# Altium schematic sheet Power-Sheet.SchDoc
size 420 x 297 mm; SheetNumber: 1; SheetTotal: 3
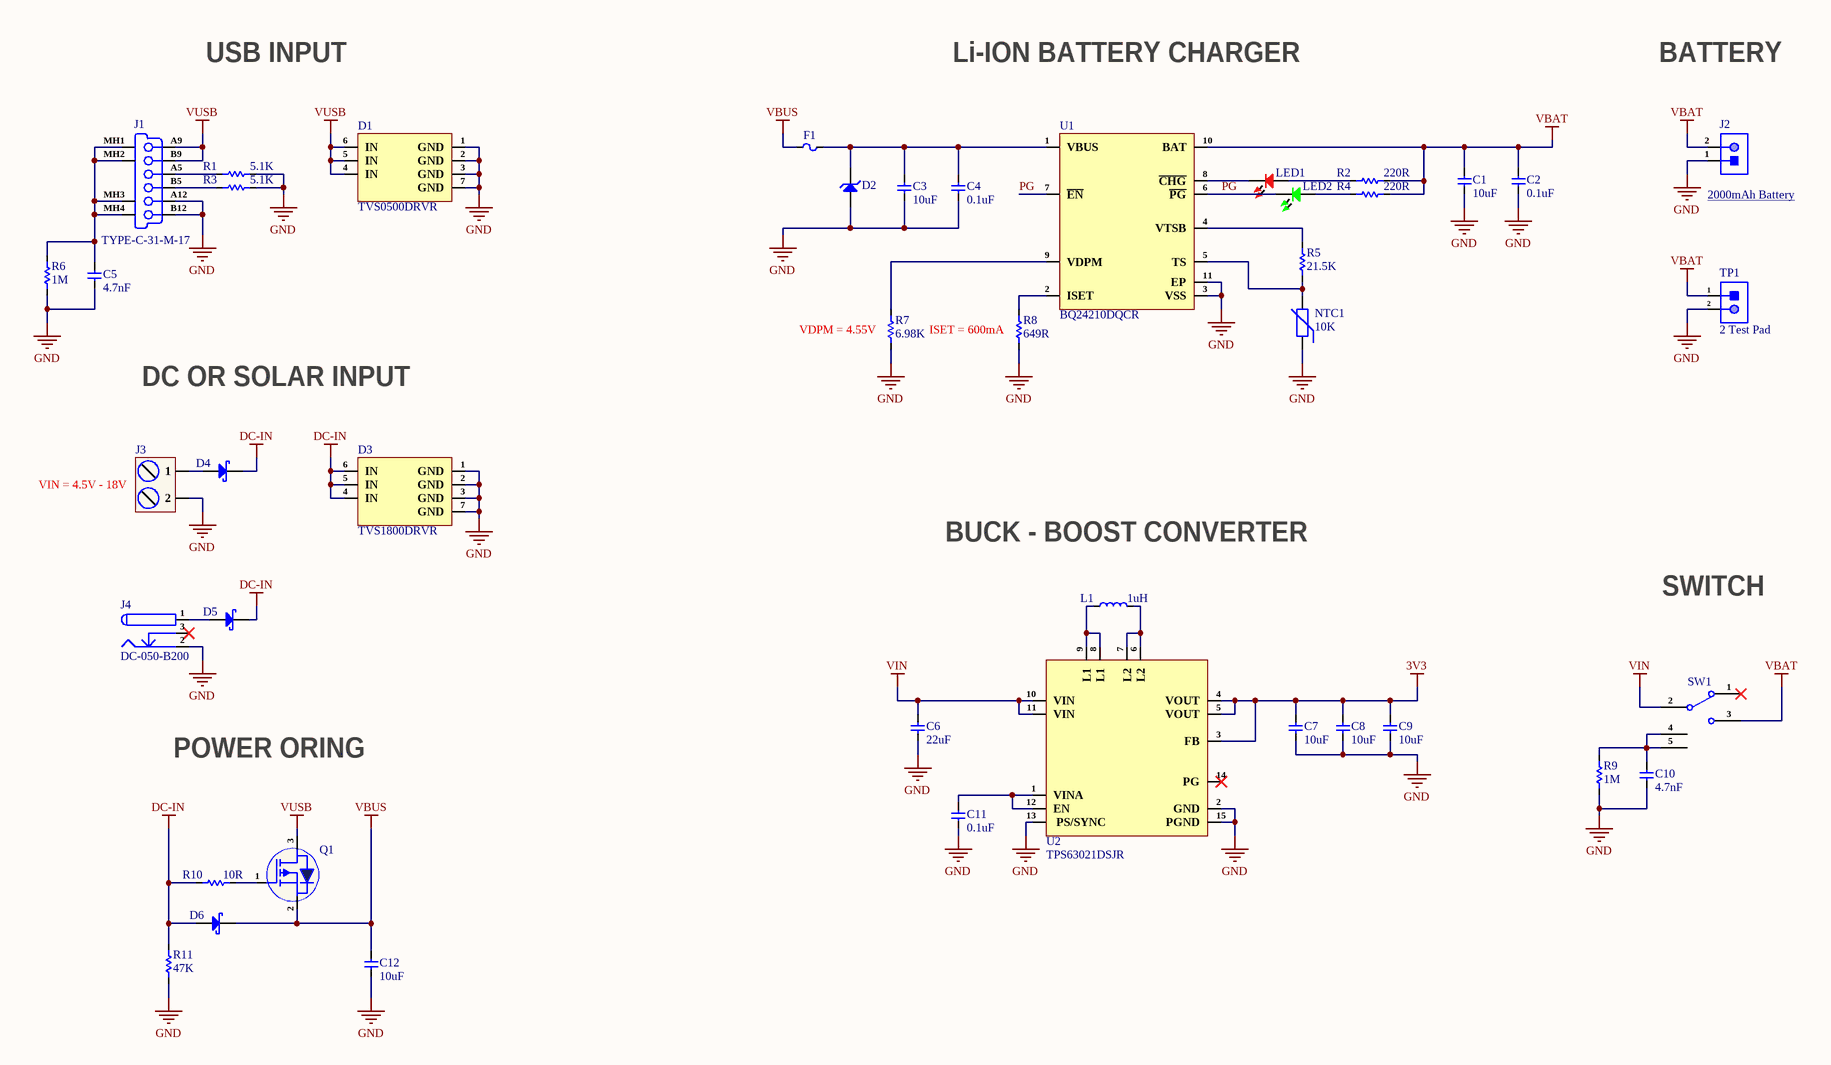
[diagram p0: Power-Sheet.SchDoc]

## Parts
C1  10uF  [Cap-0805]
C2  0.1uF  [Cap-0402]
C3  10uF  [Cap-0805]
C4  0.1uF  [Cap-0402]
C5  4.7nF  [Cap-1206]
C6  22uF  [Cap-0805]
C7  10uF  [Cap-0603]
C8  10uF  [Cap-0603]
C9  10uF  [Cap-0603]
C10  4.7nF  [Cap-1206]
C11  0.1uF  [Cap-0402]
C12  10uF  [Cap-0805]
D1  TVS0500DRVR  [WSON-6(2x2)]
D2  SMBJ5355B-MS  [SMB_]  (value not drawn)
D3  TVS1800DRVR  [WSON-6(2x2)]
D4  SS24A  [SMA]  (value not drawn)
D5  SS24A  [SMA]  (value not drawn)
D6  SS24A  [SMA]  (value not drawn)
F1  1210L075/24PR  [FUSE-1210]  (value not drawn)
J1  TYPE-C-31-M-17  [TYPE-C-31-M-17_]
J2  S2B-PH-SM4-TB(LF)(SN)  [S2B-PH-SM4-TB(LF)(SN)]  (value not drawn)
J3  DB128L-5.08-2P-GN-S  [DB128L-5.08-2P-GN-S]  (value not drawn)
J4  DC-050-B200  [DC-050-B200]
L1  1uH  [IND-1008 (2520 Metric)]
LED1  RED  [LED-0603]  (value not drawn)
LED2  Emerald  [LED-0603]  (value not drawn)
NTC1  10K  [MF51B 103F3435]
Q1  AOSS21311C  [SOT-23]  (value not drawn)
R1  5.1K  [Res-0402]
R2  220R  [Res-0402]
R3  5.1K  [Res-0402]
R4  220R  [Res-0402]
R5  21.5K  [Res-0402]
R6  1M  [Res-0603]
R7  6.98K  [Res-0402]
R8  649R  [Res-0402]
R9  1M  [Res-0603]
R10  10R  [Res-0603]
R11  47K  [Res-0402]
SW1  SK-12D29-G060  [SK-12D29-G060]  (value not drawn)
TP1  2 Test Pad  [2 Test Pad]  (no BOM)
U1  BQ24210DQCR  [10-WSON (3x2)]
U2  TPS63021DSJR  [14-VSON (4x3)]

## Nets
3V3: C7.2 C8.2 C9.2 U2.3(FB) U2.4(VOUT) U2.5(VOUT)
DC-IN: D3.4(IN) D3.5(IN) D3.6(IN) D4.1(K) D5.1(K) D6.2(A) R10.1 R11.2
GND: C1.1 C2.1 C3.1 C4.1 C5.1 C6.1 C7.1 C8.1 C9.1 C10.1 C11.1 C12.1 D1.1(GND) D1.2(GND) D1.3(GND) D1.7(GND) D2.1(A) D3.1(GND) D3.2(GND) D3.3(GND) D3.7(GND) J1.A12(GND) J1.B12(GND) J2.1 J3.2 J4.2 NTC1.1 R1.2 R3.2 R6.1 R7.1 R8.1 R9.1 R11.1 TP1.2 U1.3(VSS) U1.11(EP) U2.2(GND) U2.13(PS/SYNC) U2.15(PGND)
VBAT: C1.2 C2.2 J2.2 R2.2 R4.2 SW1.3 TP1.1 U1.10(BAT)
VBUS: C12.2 D6.1(K) F1.1 Q1.2(S)
VIN: C6.2 SW1.2 U2.10(VIN) U2.11(VIN)
VUSB: D1.4(IN) D1.5(IN) D1.6(IN) J1.A9(VBUS) J1.B9(VBUS) Q1.3(D)
PG: LED2.2 U1.6(~{PG}) U1.7(~{EN})
NetC3_2: C3.2 C4.2 D2.2(K) F1.2 U1.1(VBUS)
NetC5_2: C5.2 J1.MH1(Tab) J1.MH2(Tab) J1.MH3(Tab) J1.MH4(Tab) R6.2
NetC10_2: C10.2 R9.2 SW1.4 SW1.5
NetC11_2: C11.2 U2.1(VINA) U2.12(EN)
NetD4_2: D4.2(A) J3.1
NetD5_2: D5.2(A) J4.1
NetJ1_A5: J1.A5(CC1) R1.1
NetJ1_B5: J1.B5(CC2) R3.1
NetL1_1: L1.1 U2.8(L1) U2.9(L1)
NetL1_2: L1.2 U2.6(L2) U2.7(L2)
NetLED1_1: LED1.1 R2.1
NetLED1_2: LED1.2 U1.8(~{CHG})
NetLED2_1: LED2.1 R4.1
NetNTC1_2: NTC1.2 R5.1 U1.5(TS)
NetQ1_1: Q1.1(G) R10.2
NetR5_2: R5.2 U1.4(VTSB)
NetR7_2: R7.2 U1.9(VDPM)
NetR8_2: R8.2 U1.2(ISET)

Not connected (* = marked no-connect by the designer): J4 3*; SW1 1*; U2 14(PG)*

## Notes on the sheet
- USB INPUT
- Li-ION BATTERY CHARGER
- BATTERY
- (near J2) 2000mAh Battery <https://vi.aliexpress.com/item/1005009196364640.html>
- (near R7) VDPM = 4.55V
- (near R8) ISET = 600mA
- DC OR SOLAR INPUT
- (near J3) VIN = 4.5V - 18V
- BUCK - BOOST CONVERTER
- SWITCH
- POWER ORING
- File:
- Title:
- Date:
- Page
- Num:
- Total:
- Drawn By: Huzaifa Ali

## Library data of the parts
C1 C3 C12 = GRM21BZ71E106KE15L: CAP CER 10UF 25V X7R 0805; Manufacturer: Murata; Item Type: Capacitors; Material: 4241ConductorMaterial; Tolerance: 10%; Supplier: Mouser; LCSC Part Number: C237493; Manufacturer Part Number: GRM21BZ71E106KE15L; RoHS: Yes; Stock: 43117; Pricing: 1=0.34, 10=0.142, 50=0.142, 100=0.096, 1000=0.086, 10000=0.058 (USD); Case/Package: 339Case; Min Operating Temperature: -55°C; Max Operating Temperature: 125°C; Value: 10uF; Voltage Rating: 25V; Length: 2mm; Width: 1.25mm; Height: 1.45mm; Thickness: 1.25mm; RoHS Compliant: Yes
C2 C4 C11 = CC0402KRX7R8BB104: CAP CER 0.1UF 25V X7R 0402; Manufacturer: Yageo; Tolerance: 10%; Capacitance: 100nF; Dissipation Factor: 3.5%; Supplier 1: Digi-Key; Manufacturer Part Number: CC0402KRX7R8BB104; RoHS: Yes; Category: Ceramic Capacitors; Stock 1: 1841009; Pricing 1: 1=0.10000, 10=0.03100, 50=0.01700, 100=0.01390, 500=0.00990, 1000=0.00777, 2500=0.00707, 5000=0.00650 (USD); Mount: Surface Mount; Case/Package: 0402; Case Code (Imperial): 0402; Case Code (Metric): 1005; Min Operating Temperature: -55°C; Max Operating Temperature: 125°C; Dielectric: X7R; Voltage Rating: 25V; Voltage Rating (DC): 25V; Packaging: Tape and Reel; Termination: SMD/SMT; Resistor Type: Ceramic; Length: 1mm; Width: 0.02inch; Height: 0.5mm; Thickness: 0.022inch; Depth: 0.5mm; Radiation Hardening: No; Lead Free: Lead Free; Halogen Free: Halogen Free; ComponentLink1URL: https://datasheet.ciiva.com/11464/upy-gphc-x7r-6-3v-to-50v-8-11464889.pdf?src-supplier=Avnet; ComponentLink1Description: https://datasheet.ciiva.com/11464/upy-gphc-x7r-6-3v-to-50v-8-11464889.pdf?src-supplier=Avnet; ComponentLink2URL: https://datasheet.ciiva.com/13210/upy-gphc-x7r-6-3v-to-50v-8-12304-13210908.pdf?src-supplier=Mouser; ComponentLink2Description: https://datasheet.ciiva.com/13210/upy-gphc-x7r-6-3v-to-50v-8-12304-13210908.pdf?src-supplier=Mouser; ComponentLink3URL: https://datasheet.ciiva.com/17437/upy-gphc-x7r-6-3v-to-50v-8-17437357.pdf?src-supplier=Avnet+Europe; ComponentLink3Description: https://datasheet.ciiva.com/17437/upy-gphc-x7r-6-3v-to-50v-8-17437357.pdf?src-supplier=Avnet+Europe; Supplier Part Number 1: 311-2077-1-ND; LCSC Part Number: C105883
C5 C10 = CC1206KKX7RCBB472: CAP CER 4700PF 1KV X7R 1206; Manufacturer: Yageo; Dielectric Material: Ceramic; Tolerance: 10%; Item Type: Capacitor; Supplier 1: Future Electronics; Manufacturer Part Number: CC1206KKX7RCBB472; RoHS: Yes; Category: Ceramic Capacitors; Stock 1: 180000; Pricing 1: 3000=0.02860, 9000=0.02750, 15000=0.02700, 45000=0.02600, 75000=0.02510 (USD); Mount: Surface Mount; Case/Package: 1206; Number of Pins: 2; Case Code (Imperial): 1206; Case Code (Metric): 3216; Weight: 0.000571oz; Min Operating Temperature: -55°C; Max Operating Temperature: 125°C; Voltage Rating: 1kV; Capacitance: 4.7nF; Packaging: Tape and Reel; Voltage Rating (DC): 1kV; Dielectric: X7R; Termination: SMD/SMT; Resistor Type: Ceramic; Series: CC; Length: 3.2mm; Width: 0.063inch; Thickness: 0.057inch; Depth: 1.6mm; Radiation Hardening: No; Lead Free: Lead Free; RoHS Compliant: Yes; ComponentLink1URL: https://datasheet.ciiva.com/13208/upy-gp-np0-16v-to-50v-8-13208693.pdf?src-supplier=Mouser; ComponentLink1Description: https://datasheet.ciiva.com/13208/upy-gp-np0-16v-to-50v-8-13208693.pdf?src-supplier=Mouser; ComponentLink2URL: https://datasheet.ciiva.com/11466/hv-11466701.pdf?src-supplier=Avnet; ComponentLink2Description: https://datasheet.ciiva.com/11466/hv-11466701.pdf?src-supplier=Avnet; Supplier Part Number 1: 7130131; LCSC Part Number: C107198
C6 = GRM21BZ71A226ME15L: CAP CER 22UF 10V X7R 0805; Manufacturer: Murata; Material: 4241ConductorMaterial; Tolerance: 20%; Item Type: Capacitor; Supplier: Digi-Key; Supplier Part Number: 490-GRM21BZ71A226ME15LCT-ND; Manufacturer Part Number: GRM21BZ71A226ME15L; RoHS: Yes; Category: Ceramic Capacitors; Stock: 49126; Pricing: 1=0.39, 10=0.259, 50=0.191, 100=0.1556, 500=0.12282, 1000=0.10372 (USD); Package: 0805; Min Operating Temperature: -55°C; Max Operating Temperature: 125°C; Value: 22uF; Voltage Rating: 10V; Length: 2mm; Width: 1.25mm; Height: 1.45mm; Thickness: 1.25mm; ComponentLink1URL: https://datasheet.octopart.com/GRM21BZ71A226ME15L-Murata-datasheet-165579666.pdf?src-supplier=TME; ComponentLink1Description: https://datasheet.octopart.com/GRM21BZ71A226ME15L-Murata-datasheet-165579666.pdf?src-supplier=TME; LCSC Part Number: C907991; ComponentLink2Description: LCSC; ComponentLink2URL: https://www.lcsc.com/product-detail/Multilayer-Ceramic-Capacitors-MLCC-SMD-SMT_Murata-Electronics-GRM21BZ71A226ME15L_C907991.html
C7-C9 = GRM188Z71A106KA73D: CAP CER 10UF 10V X7R 0603; Manufacturer: Murata; Item Type: Capacitor; Material: 4241ConductorMaterial; Tolerance: 10%; Supplier: Mouser; LCSC Part Number: C2959727; Manufacturer Part Number: GRM188Z71A106KA73D; RoHS: Yes; Stock: 390983; Pricing: 1=0.36, 10=0.155, 50=0.155, 100=0.104, 1000=0.094, 10000=0.065 (USD); Case/Package: 345Case; Min Operating Temperature: -55°C; Max Operating Temperature: 125°C; Value: 10uF; Voltage Rating: 10V; Length: 1.6mm; Width: 800um; Height: 1mm; Thickness: 800um; RoHS Compliant: Yes; ComponentLink1URL: https://datasheet.octopart.com/GRM188Z71A106KA73D-Murata-datasheet-165579666.pdf?src-supplier=TME; ComponentLink1Description: https://datasheet.octopart.com/GRM188Z71A106KA73D-Murata-datasheet-165579666.pdf?src-supplier=TME
D1 = TVS0500DRVR: 9.5V 400W 7.5V 5V WSON-6(2x2) ESD and Surge Protection (TVS/ESD) ROHS; Manufacturer: Texas Instruments; Item Type: TVS Diodes; Supplier: Digikey; LCSC Part Number: C609571; Manufacturer Part Number: TVS0500DRVR; RoHS: Yes; Stock: 3745; Pricing: 1=0.51, 10=0.373, 100=0.254, 500=0.199, 1000=0.178 (USD); ComponentLink1URL: http://www.ti.com/lit/ds/symlink/tvs0500.pdf?src-supplier=Farnell; ComponentLink1Description: http://www.ti.com/lit/ds/symlink/tvs0500.pdf?src-supplier=Farnell; ComponentLink2URL: http://www.ti.com/lit/ds/symlink/tvs0500.pdf?src-supplier=Digikey; ComponentLink2Description: http://www.ti.com/lit/ds/symlink/tvs0500.pdf?src-supplier=Digikey
D2 = SMBJ5355B-MS: Independent 5W 18V SMB Zener Diodes ROHS; Manufacturer: MSKSEMI; Item Type: Diode; Manufacturer Part Number: SMBJ5355B-MS; Package: SMB; LCSC Part Number: C18547762; ComponentLink1Description: LCSC; ComponentLink1URL: https://lcsc.com/product-detail/Zener-Diodes_MSKSEMI-SMBJ5355B-MS_C18547762.html
D3 = TVS1800DRVR: 1 Surface Mount WSON-6(2x2) Surge Protection Devices (SPDs) ROHS; Manufacturer: Texas Instruments; Item Type: ESD Diode; Supplier: Mouser; LCSC Part Number: C2649846; Manufacturer Part Number: TVS1800DRVR; RoHS: Yes; Stock: 5073; Pricing: 1=0.5, 10=0.388, 50=0.388, 100=0.294, 1000=0.227, 10000=0.185 (USD); Pins: 6NUMBER; Length: 2mm; Width: 2mm; Height: 800um; Thickness: 750um; ComponentLink1URL: http://www.ti.com/general/docs/suppproductinfo.tsp?distId=10&amp;gotoUrl=http%3A%2F%2Fwww.ti.com%2Flit%2Fgpn%2Ftvs1800&src-supplier=Digikey; ComponentLink1Description: http://www.ti.com/general/docs/suppproductinfo.tsp?distId=10&amp;gotoUrl=http%3A%2F%2Fwww.ti.com%2Flit%2Fgpn%2Ftvs1800&src-supplier=Digikey
D4-D6 = SS24A: 40V 500mV@2A 2A SMA(DO-214AC) Schottky Barrier Diodes (SBD) ROHS; Manufacturer: Guangdong Hottech; Manufacturer Part Number: SS24A; Package: SMA(DO-214AC); LCSC Part Number: C2886579; ComponentLink1Description: LCSC; ComponentLink1URL: https://www.lcsc.com/product-detail/Schottky-Barrier-Diodes-SBD_Guangdong-Hottech-SS24A_C2886579.html
F1 = 1210L075/24PR: 24V 750mA 100A 1.5A 1210 Resettable Fuses ROHS; Manufacturer: Littlefuse; Item Type: Fuse; Manufacturer Part Number: 1210L075/24PR; Supplier: Digikey; Supplier Part Number: F4146CT-ND; RoHS: Yes; Category: PTC Resettable Fuses; Stock: 2300; Pricing: 1=0.98, 5=0.81, 10=0.747, 50=0.6196, 100=0.5716, 250=0.51376, 500=0.47378, 1000=0.43676 (USD); Current Rating: 100A; Voltage Rating: 24V; Height: 1.8mm; Lead Free: 5697LeadFree; ComponentLink1URL: https://datasheet.ciiva.com/8005/littelfuse-ptc-1210l-8005372.pdf?src-supplier=Element14; ComponentLink1Description: https://datasheet.ciiva.com/8005/littelfuse-ptc-1210l-8005372.pdf?src-supplier=Element14; ComponentLink2URL: https://datasheet.ciiva.com/326/littelfuse-ptc-1210l-326060.pdf?src-supplier=Digikey; ComponentLink2Description: https://datasheet.ciiva.com/326/littelfuse-ptc-1210l-326060.pdf?src-supplier=Digikey; ComponentLink3URL: https://datasheet.ciiva.com/326/littelfuse-ptc-1210l-326061.pdf?src-supplier=Digikey; ComponentLink3Description: https://datasheet.ciiva.com/326/littelfuse-ptc-1210l-326061.pdf?src-supplier=Digikey; ComponentLink4URL: https://datasheet.ciiva.com/326/littelfuse-ptc-1210l-326062.pdf?src-supplier=Digikey; ComponentLink4Description: https://datasheet.ciiva.com/326/littelfuse-ptc-1210l-326062.pdf?src-supplier=Digikey; LCSC Part Number: C207045
J1 = TYPE-C-31-M-17: Receptacle USB - Type C 6 - USB Connectors ROHS; Manufacturer: Koren Hroparts Elec; Manufacturer Part Number: Type-C-31-M-17; Footprint: Custom; ComponentLink1Description: LCSC; ComponentLink1URL: https://www.lcsc.com/product-detail/USB-Connectors_Korean-Hroparts-Elec-TYPE-C-31-M-17_C283540.html; LCSC Part Number: C283540; Item Type: Connector
J2 = S2B-PH-SM4-TB(LF)(SN): CONN HEADER SMD R/A 2POS 2MM; Manufacturer: JST; Item Type: Connectors; Voltage Rating: 100V; Current Rating: 3A; Insulation Resistance: 1GR; Number of Positions: 2; Gender: 29Gender; Number of Contacts: 2NUMBER; Max Current Rating: 2A; Contact Resistance: 20mR; Supplier: Future Electronics; LCSC Part Number: C295747; Manufacturer Part Number: S2B-PH-SM4-TB(LF)(SN); RoHS: No; Stock: 5000; Pricing: 1000=0.27, 2000=0.265, 3000=0.265, 4000=0.26, 5000=0.25 (USD); Mounting Technology: Surface Mount; Pins: 2NUMBER; Contact Material: Copper Alloy; Color: 46,47Colour; Contact Plating: 154ConductorMaterial; Housing Color: 50Colour; Housing Material: 4302ConductorMaterial; Weight: 28.349523g; Contact Shape: Square; Contact Finish - Mating: TIN; Insulation Material: Nylon; Insulation Color: Natural; Min Operating Temperature: -25°C; Max Operating Temperature: 85°C; Number of Rows: 1; Termination: Solder; Series: PH; Packaging: Cut Tape; Orientation: 5496OrientationType; Max Voltage Rating (AC): 100V; Voltage Rating (AC): 100V; Working Voltage: 100V; Connector Type: Header; Fastening Type: Detent; Contact Type: Male Pin; Voltage Rating (DC): 100V; Number of Poles: 2NUMBER; Length: 11.9mm; Width: 2.34mm; Height: 6mm; Pitch: 2mm; Depth: 7.6mm; Lead Pitch: 2mm; Contact Mating Length: 3.302mm; Flammability Rating: UL94 V-0; Reach SVHC Compliant: 4186SVHC; Lead Free: 5697LeadFree; ComponentLink1URL: http://www.farnell.com/datasheets/1699381.pdf?src-supplier=Farnell; ComponentLink1Description: http://www.farnell.com/datasheets/1699381.pdf?src-supplier=Farnell; ComponentLink2URL: http://datasheet.octopart.com/S2B-PH-SM4-TB-%28LF%29%28SN%29-JST-datasheet-12510261.pdf?src-supplier=Distrelec; ComponentLink2Description: http://datasheet.octopart.com/S2B-PH-SM4-TB-%28LF%29%28SN%29-JST-datasheet-12510261.pdf?src-supplier=Distrelec; ComponentLink3URL: http://www.farnell.com/datasheets/1699381.pdf?src-supplier=Newark; ComponentLink3Description: http://www.farnell.com/datasheets/1699381.pdf?src-supplier=Newark; ComponentLink4URL: https://datasheet.octopart.com/S2B-PH-SM4-TB%28LF%29%28SN%29-JST-datasheet-56537.pdf?src-supplier=Future+Electronics; ComponentLink4Description: https://datasheet.octopart.com/S2B-PH-SM4-TB%28LF%29%28SN%29-JST-datasheet-56537.pdf?src-supplier=Future+Electronics; ComponentLink5URL: http://www.farnell.com/datasheets/1699381.pdf?src-supplier=Element14; ComponentLink5Description: http://www.farnell.com/datasheets/1699381.pdf?src-supplier=Element14; ComponentLink6URL: https://datasheet.octopart.com/S2B-PH-SM4-TB-%28LF%29%28SN%29-JST-datasheet-12510261.pdf?src-supplier=TME; ComponentLink6Description: https://datasheet.octopart.com/S2B-PH-SM4-TB-%28LF%29%28SN%29-JST-datasheet-12510261.pdf?src-supplier=TME
J3 = DB128L-5.08-2P-GN-S: 1x2P 18A -40℃~+105℃ 250V Green 12~30 Straight 5.08mm 2.5 1 2 Plugin,P=5.08mm Screw terminal ROHS; Manufacturer: DORABO; Item Type: Terminal Block; Manufacturer Part Number: DB128L-5.08-2P-GN-S; Package: Plugin,P=5.08mm; LCSC Part Number: C395868; ComponentLink1Description: LCSC; ComponentLink1URL: https://www.lcsc.com/product-detail/Screw-terminal_DORABO-DB128L-5-08-2P-GN-S_C395868.html
J4 = DC-050-B200: Surface Mount DC Power Receptacle -20℃~+70℃ 2mm 6.4mm 2A 30V SMD AC/DC Power Connectors ROHS; Manufacturer: XUNPU; Item Type: DC Jack; Manufacturer Part Number: DC-050-B200; Package: Custom; LCSC Part Number: C720582; ComponentLink1Description: LCSC; ComponentLink1URL: https://www.lcsc.com/product-detail/AC-DC-Power-Connectors_XUNPU-DC-050-B200_C720582.html
L1 = DFE252012P-1R0M=P2: FIXED IND 1UH 3.2A 0.042OHM SMD; Manufacturer: Murata; Item Type: Inductor; Core Material: Ferrite; Current Rating: 4.3A; Shielding: Shielded; DC Resistance (DCR): 42mR; Test Frequency: 1MHz; Tolerance: 20%; Supplier: Future Electronics; LCSC Part Number: C882955; Manufacturer Part Number: DFE252012P-1R0M=P2; RoHS: Yes; Stock: 30000; Pricing: 3000=0.103, 6000=0.1, 9000=0.0987, 12000=0.0976, 15000=0.0942 (USD); Mounting Technology: Surface Mount; Case/Package: 1008; Case Code (Metric): 2520; Case Code (Imperial): 1008; Min Operating Temperature: -40°C; Max Operating Temperature: 125°C; Value: 1uH; Packaging: Cut Tape; Max DC Current: 3.2A; Series: DFE252012P; Inductance Tolerance: 20%; RMS Current (Irms): 3.2A; Saturation Current: 4.3A; ESR: 42mR; Length: 0.098inch; Width: 0.079inch; Height: 1.2mm; Height - Seated (Max): 0.039inch; Depth: 2mm; RoHS Compliant: Yes; ComponentLink1URL: http://www.farnell.com/datasheets/2550134.pdf?src-supplier=Farnell; ComponentLink1Description: http://www.farnell.com/datasheets/2550134.pdf?src-supplier=Farnell; ComponentLink2URL: https://www.murata.com/~/media/webrenewal/products/inductor/chip/tokoproducts/wirewoundmetalalloychiptype/m_dfe252012p.ashx?src-supplier=Digikey; ComponentLink2Description: https://www.murata.com/~/media/webrenewal/products/inductor/chip/tokoproducts/wirewoundmetalalloychiptype/m_dfe252012p.ashx?src-supplier=Digikey; ComponentLink3URL: http://www.murata.com/~/media/webrenewal/products/inductor/chip/tokoproducts/wirewoundmetalalloychiptype/m_dfe252012p.ashx?src-supplier=Digikey; ComponentLink3Description: http://www.murata.com/~/media/webrenewal/products/inductor/chip/tokoproducts/wirewoundmetalalloychiptype/m_dfe252012p.ashx?src-supplier=Digikey; ComponentLink4URL: http://www.toko.co.jp/products/pdf/inductors/dfe252012p.pdf?src-supplier=Avnet; ComponentLink4Description: http://www.toko.co.jp/products/pdf/inductors/dfe252012p.pdf?src-supplier=Avnet
LED1 = NCD0603R3: RED LED 0603 Light Emitting Diodes; Manufacturer: Foshan NationStar Optoelectronics; Manufacturer Part Number: NCD0603R3; Package: 0603; Item Type: LED; LCSC Part Number: C3151730; ComponentLink1Description: LCSC; ComponentLink1URL: https://www.lcsc.com/product-detail/Light-Emitting-Diodes-LED_Foshan-NationStar-Optoelectronics-NCD0603R3_C3151730.html
LED2 = NCD0603G2: Emerald 0603 Light Emitting Diodes (LED) ROHS; Manufacturer: Foshan NationStar Optoelectronics; Manufacturer Part Number: NCD0603G2; Package: 0603; LCSC Part Number: C87326; Item Type: LED; ComponentLink1Description: LCSC; ComponentLink1URL: https://www.lcsc.com/product-detail/Light-Emitting-Diodes-LED_Foshan-NationStar-Optoelectronics-NCD0603G2_C87326.html
NTC1 = MF51B 103F3435: 10kΩ 50mW ±1% NTC Thermistors ROHS; Manufacturer: Nanjing Shiheng Elec; Manufacturer Part Number: MF51B 103F3435; LCSC Part Number: C394029; Item Type: NTC Thermistors; ComponentLink1Description: LCSC; ComponentLink1URL: https://lcsc.com/product-detail/NTC-Thermistors_Nanjing-Shiheng-Elec-MF51B-103F3435_C394029.html
Q1 = AOSS21311C: MOSFET P-CH 30V 4.3A SOT23-3; Manufacturer: Alpha & Omega Semiconductor; Supplier: Digikey; Supplier Part Number: 785-AOSS21311CCT-ND; Manufacturer Part Number: AOSS21311C; RoHS: Yes; Category: Transistors; Stock: 15013; Pricing: 1=0.44, 10=0.314, 100=0.1582, 500=0.14016, 1000=0.10908 (USD); LCSC Part Number: C3280149; Item Type: MOSFET
R1 R3 = RC0402FR-075K1L: RES 5.1K OHM 1% 1/16W 0402; Manufacturer: Yageo; Power Rating: 63mW; Resistance: 5.1kR; Temperature Coefficient: 100ppm/°C; Voltage Rating: 50V; Item Type: Resistor; Supplier 1: Avnet; Manufacturer Part Number: RC0402FR-075K1L; RoHS: Yes; Category: Chip SMD Resistors; Stock 1: 65000; Pricing 1: 10000=0.00085 (USD); Case/Package: 0402; Case Code (Metric): 1005; Case Code (Imperial): 0402; Min Operating Temperature: -55°C; Max Operating Temperature: 155°C; Tolerance: 1%; Technology: THICK FILM; Packaging: Tape and Reel; Package Quantity: 1; Resistor Type: Thick Film; Number of Terminations: 2; Termination: SMD/SMT; Max Power Dissipation: 63mW; Voltage Rating (DC): 50V; Working Voltage: 50V; Features: Moisture Resistant; Series: RC; Resistance Tolerance: 1%; Construction: Rectangular; Length: 1mm; Width: 0.02inch; Height: 0.016inch; Depth: 0.5mm; RoHS Compliant: Yes; Military Standard: Not; Lead Free: Lead Free; ComponentLink1URL: https://datasheet.ciiva.com/7983/1018594-7983519.pdf?src-supplier=Element14; ComponentLink1Description: https://datasheet.ciiva.com/7983/1018594-7983519.pdf?src-supplier=Element14; ComponentLink2URL: https://datasheet.ciiva.com/46394/1018594-46394936.pdf?src-supplier=Element14; ComponentLink2Description: https://datasheet.ciiva.com/46394/1018594-46394936.pdf?src-supplier=Element14; ComponentLink3URL: https://datasheet.ciiva.com/2453/pyu-r-int-thick-7-2453401.pdf?src-supplier=Digi-Key; ComponentLink3Description: https://datasheet.ciiva.com/2453/pyu-r-int-thick-7-2453401.pdf?src-supplier=Digi-Key; ComponentLink4URL: https://datasheet.ciiva.com/2453/pyu-r-int-thick-7-2453402.pdf?src-supplier=Digi-Key; ComponentLink4Description: https://datasheet.ciiva.com/2453/pyu-r-int-thick-7-2453402.pdf?src-supplier=Digi-Key; ComponentLink5URL: https://datasheet.ciiva.com/2453/pyu-r-int-thick-7-2453400.pdf?src-supplier=Digi-Key; ComponentLink5Description: https://datasheet.ciiva.com/2453/pyu-r-int-thick-7-2453400.pdf?src-supplier=Digi-Key; ComponentLink6URL: https://datasheet.ciiva.com/12558/pyu-rc0402-51-rohs-l-6-r-8721-12558460.pdf?src-supplier=Mouser; ComponentLink6Description: https://datasheet.ciiva.com/12558/pyu-rc0402-51-rohs-l-6-r-8721-12558460.pdf?src-supplier=Mouser; ComponentLink7URL: https://datasheet.ciiva.com/16744/pyu-rc0402-51-rohs-l-6-r-16744283.pdf?src-supplier=Future+Electronics; ComponentLink7Description: https://datasheet.ciiva.com/16744/pyu-rc0402-51-rohs-l-6-r-16744283.pdf?src-supplier=Future+Electronics; ComponentLink8URL: https://datasheet.ciiva.com/15189/getdatasheetpartid-323636-15189493.pdf?src-supplier=Verical; ComponentLink8Description: https://datasheet.ciiva.com/15189/getdatasheetpartid-323636-15189493.pdf?src-supplier=Verical; Supplier Part Number 1: RC0402FR-075K1L; LCSC Part Number: C105872
R2 R4 = RC0402FR-07220RL: RES 220 OHM 1% 1/16W 0402; Manufacturer: Yageo; Item Type: Resistors; Power Rating: 62.5mW; Voltage Rating: 50V; Temperature Coefficient: 100ppm/°C; Max Power Dissipation: 63mW; Supplier: Digikey; LCSC Part Number: C112291; Manufacturer Part Number: RC0402FR-07220RL; RoHS: Yes; Stock: 225544; Pricing: 1=0.1, 10=0.007, 100=0.0061, 1000=0.0051, 2500=0.00408 (USD); Case/Package: 0402; Pins: 2; Case Code (Imperial): 0402; Case Code (Metric): 1005; Min Operating Temperature: -55°C; Max Operating Temperature: 155°C; Value: 220R; Tolerance: 1%; Packaging: Tape and Reel; Voltage Rating (DC): 50V; Package Quantity: 1; Termination: SMD/SMT; Resistor Type: Thick Film; Number of Terminations: 2; Features: Moisture Resistant; Series: RC; Resistance Tolerance: 1%; Construction: Rectangular; Technology: THICK FILM; Voltage Rating (AC): 50V; Length: 0.039inch; Width: 0.02inch; Height: 0.016inch; Depth: 0.5mm; Reach SVHC Compliant: No; Military Standard: Not; RoHS Compliant: Yes; Lead Free: 5697LeadFree; ComponentLink1URL: https://datasheet.ciiva.com/2453/pyu-r-int-thick-7-2453461.pdf?src-supplier=Digikey; ComponentLink1Description: https://datasheet.ciiva.com/2453/pyu-r-int-thick-7-2453461.pdf?src-supplier=Digikey
R5 = RT0402BRD0721K5L: RES SMD 21.5KOHM 0.1% 1/16W 0402; Manufacturer: Yageo; Item Type: Resistor; Value: 21.5kR; Power Rating: 62.5mW; Voltage Rating: 50V; Max Power Dissipation: 63mW; Temperature Coefficient: 25ppm/°C; Supplier: Digikey; LCSC Part Number: C852636; Manufacturer Part Number: RT0402BRD0721K5L; RoHS: Yes; Stock: 19982; Pricing: 1=0.16, 10=0.121, 50=0.0958, 100=0.0859, 500=0.0654, 1000=0.0578, 5000=0.04283 (USD); Case/Package: 0402; Case Code (Metric): 1005; Case Code (Imperial): 0402; Min Operating Temperature: -55°C; Max Operating Temperature: 155°C; Package Quantity: 10000; Packaging: Tape and Reel; Tolerance: 0.1%; Number of Terminations: 2; Termination: SMD/SMT; Voltage Rating (DC): 50V; Series: RT; Length: 0.039inch; Width: 0.02inch; Height: 0.014inch; Lead Free: Lead Free; RoHS Compliant: Yes; ComponentLink1URL: https://datasheet.ciiva.com/2582/pyu-rt-1-to-0-05-rohs-l-5-2582228.pdf?src-supplier=Digikey; ComponentLink1Description: https://datasheet.ciiva.com/2582/pyu-rt-1-to-0-05-rohs-l-5-2582228.pdf?src-supplier=Digikey; ComponentLink2URL: https://datasheet.ciiva.com/12725/pyu-rt-1-to-0-05-rohs-l-4-12725964.pdf?src-supplier=Mouser; ComponentLink2Description: https://datasheet.ciiva.com/12725/pyu-rt-1-to-0-05-rohs-l-4-12725964.pdf?src-supplier=Mouser
R6 R9 = RC0603FR-071ML: RES SMD 1M OHM 1% 1/10W 0603; Manufacturer: Yageo; Voltage Rating: 50V; Resistance: 1MR; Power Rating: 100mW; Temperature Coefficient: 100ppm/°C; Item Type: Resistor; Supplier 1: Digi-Key; Manufacturer Part Number: RC0603FR-071ML; Stock 1: 3824601; Pricing 1: 1=0.1, 10=0.023, 100=0.0094, 1000=0.00421, 2500=0.00366 (USD); Case/Package: 0603; Number of Pins: 2; Case Code (Imperial): 0603; Case Code (Metric): 1608; Min Operating Temperature: -55°C; Max Operating Temperature: 155°C; Voltage Rating (DC): 50V; Tolerance: 1%; Packaging: Tape and Reel; Package Quantity: 5000; Termination: SMD/SMT; Composition: Thick Film; Military Standard: Not; Length: 1.6mm; Height: 0.45mm; Width: 0.8mm; Depth: 0.8mm; REACH SVHC: No SVHC; Lead Free: Lead Free; ComponentLink1URL: http://www.farnell.com/datasheets/2167052.pdf?src-supplier=Mouser; ComponentLink1Description: http://www.farnell.com/datasheets/2167052.pdf?src-supplier=Mouser; ComponentLink2URL: http://www.farnell.com/datasheets/2167052.pdf?src-supplier=Element14; ComponentLink2Description: http://www.farnell.com/datasheets/2167052.pdf?src-supplier=Element14; ComponentLink3URL: http://documents.rs-components.com/techlib://itc_doclist_GB.htm?stockno=5048956&src-supplier=RSComponents; ComponentLink3Description: http://documents.rs-components.com/techlib://itc_doclist_GB.htm?stockno=5048956&src-supplier=RSComponents; Supplier Part Number 1: 311-1.00MHRDKR-ND; LCSC Part Number: C105578
R7 = RT0402BRD076K98L: RES SMD 6.98KOHM 0.1% 1/16W 0402; Manufacturer: Yageo; Value: 6.98kR; Power Rating: 62.5mW; Voltage Rating: 50V; Temperature Coefficient: 25ppm/°C; Max Power Dissipation: 63mW; Item Type: Resistor; Supplier 1: Future Electronics; Manufacturer Part Number: RT0402BRD076K98L; RoHS: Yes; Category: Chip SMD Resistors; Stock 1: 9500; Pricing 1: 1=0.173, 20=0.129, 150=0.0997, 1000=0.0719, 5000=0.0482 (USD); Case/Package: 0402; Case Code (Imperial): 0402; Case Code (Metric): 1005; Weight: 2.3E-05oz; Min Operating Temperature: -55°C; Max Operating Temperature: 155°C; Packaging: Tape and Reel; Tolerance: 0.1%; Package Quantity: 10000; Termination: SMD/SMT; Number of Terminations: 2; Voltage Rating (DC): 50V; Series: RT; Length: 0.039inch; Width: 0.5mm; Height: 0.014inch; Lead Free: Lead Free; RoHS Compliant: Yes; ComponentLink1URL: https://datasheet.ciiva.com/2582/pyu-rt-1-to-0-05-rohs-l-4-2582483.pdf?src-supplier=Digi-Key; ComponentLink1Description: https://datasheet.ciiva.com/2582/pyu-rt-1-to-0-05-rohs-l-4-2582483.pdf?src-supplier=Digi-Key; ComponentLink2URL: https://datasheet.ciiva.com/46635/pyu-rt-1-to-0-05-rohs-l-5-46635214.pdf?src-supplier=Digi-Key; ComponentLink2Description: https://datasheet.ciiva.com/46635/pyu-rt-1-to-0-05-rohs-l-5-46635214.pdf?src-supplier=Digi-Key; Supplier Part Number 1: 2098961; LCSC Part Number: C852901
R8 = RT0402BRD07649RL: RES SMD 649 OHM 0.1% 1/16W 0402; Manufacturer: Yageo; Item Type: Resistors; Power Rating: 62.5mW; Voltage Rating: 50V; Temperature Coefficient: 25ppm/°C; Max Power Dissipation: 63mW; Supplier: Digikey; LCSC Part Number: C852879; Manufacturer Part Number: RT0402BRD07649RL; RoHS: Yes; Stock: 26648; Pricing: 1=0.16, 10=0.124, 50=0.1, 100=0.0898, 500=0.06834, 1000=0.06018, 5000=0.04449 (USD); Case/Package: 0402; Case Code (Imperial): 0402; Case Code (Metric): 1005; Weight: 2.3E-05oz; Min Operating Temperature: -55°C; Max Operating Temperature: 125°C; Value: 649R; Packaging: Tape and Reel; Tolerance: 0.1%; Package Quantity: 10000; Termination: SMD/SMT; Number of Terminations: 2; Voltage Rating (DC): 50V; Series: RT; Length: 0.039inch; Width: 0.5mm; Height: 0.014inch; Lead Free: Lead Free; RoHS Compliant: Yes; ComponentLink1URL: https://datasheet.ciiva.com/2582/pyu-rt-1-to-0-05-rohs-l-5-2582460.pdf?src-supplier=Digikey; ComponentLink1Description: https://datasheet.ciiva.com/2582/pyu-rt-1-to-0-05-rohs-l-5-2582460.pdf?src-supplier=Digikey
R10 = RC0603FR-0710RL: RES SMD 10 OHM 1% 1/10W 0603; Manufacturer: Yageo; Temperature Coefficient: 200ppm/°C; Power Rating: 100mW; Voltage Rating: 50V; Item type: Resistor; Supplier 1: Digi-Key; Manufacturer Part Number: RC0603FR-0710RL; Stock 1: 10836596; Pricing 1: 1=0.1, 10=0.046, 100=0.0187, 1000=0.0084, 2500=0.00729 (USD); Case/Package: 0603; Number of Pins: 2; Case Code (Imperial): 0603; Case Code (Metric): 1608; Contact Plating: Tin,Matte; Min Operating Temperature: -55°C; Max Operating Temperature: 155°C; Resistance: 10R; Tolerance: 1%; Composition: Thick Film; Packaging: Tape and Reel; Voltage Rating (DC): 50V; Termination: SMD/SMT; Military Standard: Not; Length: 1.6mm; Height: 0.45mm; Width: 0.8mm; Depth: 0.8mm; Radiation Hardening: No; Lead Free: Lead Free; REACH SVHC: No SVHC; ComponentLink1URL: http://www.farnell.com/datasheets/1868787.pdf?src-supplier=Element14; ComponentLink1Description: http://www.farnell.com/datasheets/1868787.pdf?src-supplier=Element14; ComponentLink2URL: http://www.yageo.com/documents/recent/PYu-RC0603_51_RoHS_L_4.pdf?src-supplier=Avnet; ComponentLink2Description: http://www.yageo.com/documents/recent/PYu-RC0603_51_RoHS_L_4.pdf?src-supplier=Avnet; ComponentLink3URL: http://documents.rs-components.com/techlib://itc_doclist_GB.htm?stockno=5048984&src-supplier=RSComponents; ComponentLink3Description: http://documents.rs-components.com/techlib://itc_doclist_GB.htm?stockno=5048984&src-supplier=RSComponents; ComponentLink4URL: http://www.yageo.com/documents/recent/PYu-RC0603_51_RoHS_L_4.pdf?src-supplier=Avnet+Europe; ComponentLink4Description: http://www.yageo.com/documents/recent/PYu-RC0603_51_RoHS_L_4.pdf?src-supplier=Avnet+Europe; Supplier Part Number 1: 311-10.0HRDKR-ND; LCSC Part Number: C109318
R11 = RC0402FR-0747KL: RES 47K OHM 1% 1/16W 0402; Manufacturer: Yageo; Power Rating: 62.5mW; Temperature Coefficient: 100ppm/°C; Voltage Rating: 50V; Resistance: 47kR; Max Power Dissipation: 63mW; Item Type: Resistor; Supplier 1: Avnet; Manufacturer Part Number: RC0402FR-0747KL; RoHS: Yes; Category: Chip SMD Resistors; Stock 1: 680000; Pricing 1: 10000=0.00085, 20000=0.00087, 40000=0.00084, 60000=0.00083, 80000=0.00079, 100000=0.00078, 1000000=0.00076 (USD); Case/Package: 0402; Case Code (Imperial): 0402; Case Code (Metric): 1005; Size Code: 0402; Min Operating Temperature: -55°C; Max Operating Temperature: 155°C; Tolerance: 1%; Series: RC; Packaging: Tape and Reel; Package Quantity: 1; Termination: SMD/SMT; Resistor Type: Thick Film; Number of Terminations: 2; Features: Moisture Resistant; Resistance Tolerance: 1%; Construction: Rectangular; Length: 1mm; Width: 0.02inch; Height: 0.016inch; Depth: 0.5mm; RoHS Compliant: Yes; Military Standard: Not; Lead Free: Lead Free; ComponentLink1URL: https://datasheet.ciiva.com/46412/1018594-46412839.pdf?src-supplier=Element14; ComponentLink1Description: https://datasheet.ciiva.com/46412/1018594-46412839.pdf?src-supplier=Element14; ComponentLink2URL: https://datasheet.ciiva.com/2453/pyu-r-int-thick-7-2453389.pdf?src-supplier=Digi-Key; ComponentLink2Description: https://datasheet.ciiva.com/2453/pyu-r-int-thick-7-2453389.pdf?src-supplier=Digi-Key; ComponentLink3URL: https://datasheet.ciiva.com/2453/pyu-r-int-thick-7-2453390.pdf?src-supplier=Digi-Key; ComponentLink3Description: https://datasheet.ciiva.com/2453/pyu-r-int-thick-7-2453390.pdf?src-supplier=Digi-Key; ComponentLink4URL: https://datasheet.ciiva.com/2453/pyu-r-int-thick-7-2453388.pdf?src-supplier=Digi-Key; ComponentLink4Description: https://datasheet.ciiva.com/2453/pyu-r-int-thick-7-2453388.pdf?src-supplier=Digi-Key; ComponentLink5URL: https://datasheet.ciiva.com/15189/getdatasheetpartid-323748-15189466.pdf?src-supplier=Verical; ComponentLink5Description: https://datasheet.ciiva.com/15189/getdatasheetpartid-323748-15189466.pdf?src-supplier=Verical; ComponentLink6URL: https://datasheet.ciiva.com/16793/pyu-rc0402-51-rohs-l-6-r-16793430.pdf?src-supplier=Future+Electronics; ComponentLink6Description: https://datasheet.ciiva.com/16793/pyu-rc0402-51-rohs-l-6-r-16793430.pdf?src-supplier=Future+Electronics; Supplier Part Number 1: RC0402FR-0747KL; LCSC Part Number: C93943
SW1 = SK-12D29-G060: Lying 1A SPDT 9.6mm 8.6mm 24V 3.6mm Black PCPin 10000 Rectangular columnar -25℃~+70℃ Plugin Slide Switches ROHS; Manufacturer: G-Switch; Manufacturer Part Number: SK-12D29-G060; Package: Custom; LCSC Part Number: C2848877; Item Type: Slide Switch; ComponentLink1Description: LCSC; ComponentLink1URL: https://www.lcsc.com/product-detail/Slide-Switches_G-Switch-SK-12D29-G060_C2848877.html
TP1 = 2 Test Pad: Wire Connecting Pad; Item Type: Test Point; Manufacturer Part Number: 2 Test Pad
U1 = BQ24210DQCR: IC BATT CHG LI-ION 1CELL 10WSON; Manufacturer: Texas Instruments; Supplier: Mouser; LCSC Part Number: C524795; Manufacturer Part Number: BQ24210DQCR; RoHS: Yes; Item Type: IC; Stock: 11128; Pricing: 1=2.67, 10=1.99, 50=1.82, 100=1.64, 1000=1.45, 10000=1.31 (USD); ComponentLink1URL: https://datasheet.ciiva.com/4874/slusa76a-128668-4874253.pdf?src-supplier=Mouser; ComponentLink1Description: https://datasheet.ciiva.com/4874/slusa76a-128668-4874253.pdf?src-supplier=Mouser; ComponentLink2URL: https://datasheet.ciiva.com/15223/getdatasheetpartid-517676-15223141.pdf?src-supplier=Verical; ComponentLink2Description: https://datasheet.ciiva.com/15223/getdatasheetpartid-517676-15223141.pdf?src-supplier=Verical; ComponentLink3URL: https://datasheet.ciiva.com/1934/bq24210-1934532.pdf?src-supplier=Digikey; ComponentLink3Description: https://datasheet.ciiva.com/1934/bq24210-1934532.pdf?src-supplier=Digikey
U2 = TPS63021DSJR: IC REG BUCK BST 3.3V 3.5A 14VSON; Manufacturer: Texas Instruments; Efficiency: 96%; Number of Outputs: 1; Max Output current: 3A; Min Input Voltage: 1.8V; Max Supply Voltage: 5.5V; Switching Frequency: 2.4MHz; Synchronous Rectifier: Yes; Quiescent Current: 50uA; Output Type: Fixed; Supplier: Mouser; LCSC Part Number: C202140; Manufacturer Part Number: TPS63021DSJR; RoHS: Yes; Item Type: IC; Stock: 4678; Pricing: 1=2.63, 10=1.96, 50=1.8, 100=1.61, 1000=1.43, 10000=1.35 (USD); Mounting Technology: Surface Mount; Case/Package: VSON; Pins: 14; Min Operating Temperature: -40°C; Max Operating Temperature: 85°C; Package Quantity: 1; Packaging: Cut Tape; Output Voltage: 3.3V; Output Current: 3A; Operating Supply Voltage: 5.5V; Series: -; Reach SVHC Compliant: No; Lead Free: Lead Free; RoHS Compliant: Yes; ComponentLink1URL: https://datasheet.ciiva.com/2026/tps63021-2026362.pdf?src-supplier=Digikey; ComponentLink1Description: https://datasheet.ciiva.com/2026/tps63021-2026362.pdf?src-supplier=Digikey; ComponentLink2URL: https://datasheet.ciiva.com/2026/tps63021-2026361.pdf?src-supplier=Digikey; ComponentLink2Description: https://datasheet.ciiva.com/2026/tps63021-2026361.pdf?src-supplier=Digikey; ComponentLink3URL: https://datasheet.ciiva.com/2026/tps63021-2026363.pdf?src-supplier=Digikey; ComponentLink3Description: https://datasheet.ciiva.com/2026/tps63021-2026363.pdf?src-supplier=Digikey; ComponentLink4URL: https://datasheet.ciiva.com/3221/tps63020-3221510.pdf?src-supplier=Avnet; ComponentLink4Description: https://datasheet.ciiva.com/3221/tps63020-3221510.pdf?src-supplier=Avnet